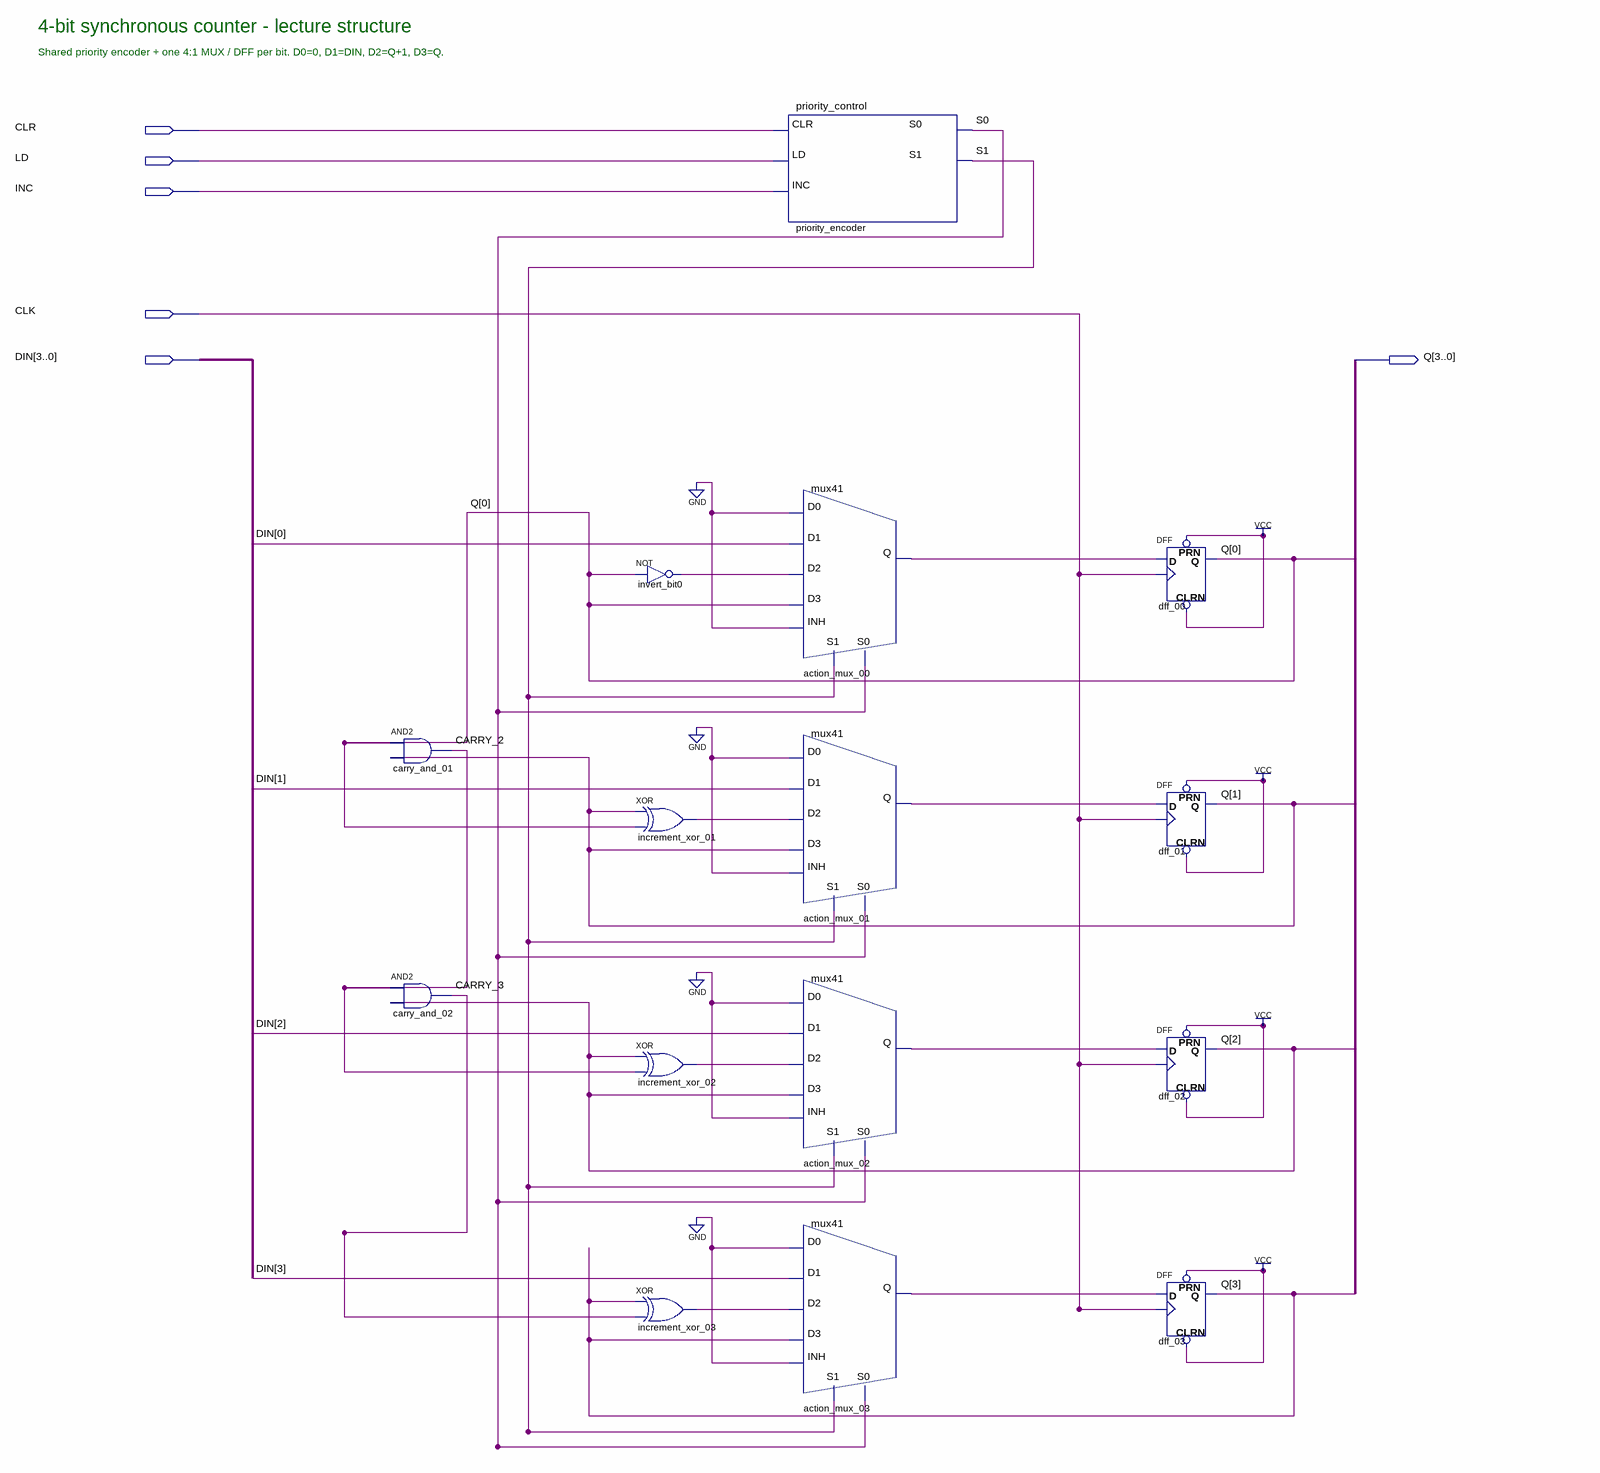
[diagram p0: schematic sheet]
// Quartus schematic counter4.bdf as structural Verilog: 15 symbols, 6 pins
module counter4 (
  input  CLR,
  input  LD,
  input  INC,
  input  CLK,
  input  [3:0] DIN,
  output [3:0] Q
);

  wire CARRY_2, CARRY_3, NEXT_0, NEXT_1, NEXT_2, NEXT_3, PLUS1_0, PLUS1_1, PLUS1_2, PLUS1_3, S0, S1;

  and carry_and_01 (CARRY_2, Q[0], Q[1]);
  and carry_and_02 (CARRY_3, CARRY_2, Q[2]);
  not invert_bit0 (PLUS1_0, Q[0]);
  xor increment_xor_01 (PLUS1_1, Q[1], Q[0]);
  xor increment_xor_02 (PLUS1_2, Q[2], CARRY_2);
  xor increment_xor_03 (PLUS1_3, Q[3], CARRY_3);
  priority_control priority_encoder (.CLR(CLR), .LD(LD), .INC(INC), .S0(S0), .S1(S1));
  mux41 action_mux_00 (.D0(1'b0), .D1(DIN[0]), .D2(PLUS1_0), .D3(Q[0]), .INH(1'b0), .S1(S1), .S0(S0), .Q(NEXT_0));
  mux41 action_mux_01 (.D0(1'b0), .D1(DIN[1]), .D2(PLUS1_1), .D3(Q[1]), .INH(1'b0), .S1(S1), .S0(S0), .Q(NEXT_1));
  mux41 action_mux_02 (.D0(1'b0), .D1(DIN[2]), .D2(PLUS1_2), .D3(Q[2]), .INH(1'b0), .S1(S1), .S0(S0), .Q(NEXT_2));
  mux41 action_mux_03 (.D0(1'b0), .D1(DIN[3]), .D2(PLUS1_3), .D3(Q[3]), .INH(1'b0), .S1(S1), .S0(S0), .Q(NEXT_3));
  DFF dff_00 (.CLRN(1'b1), .CLK(CLK), .D(NEXT_0), .PRN(1'b1), .Q(Q[0]));
  DFF dff_01 (.CLRN(1'b1), .CLK(CLK), .D(NEXT_1), .PRN(1'b1), .Q(Q[1]));
  DFF dff_02 (.CLRN(1'b1), .CLK(CLK), .D(NEXT_2), .PRN(1'b1), .Q(Q[2]));
  DFF dff_03 (.CLRN(1'b1), .CLK(CLK), .D(NEXT_3), .PRN(1'b1), .Q(Q[3]));

  // Notes on the sheet:
  //   4-bit synchronous counter - lecture structure
  //   Shared priority encoder + one 4:1 MUX / DFF per bit. D0=0, D1=DIN, D2=Q+1, D3=Q.
endmodule
